# Altium schematic sheet Inputs-and-modules.SchDoc
size A4; SheetNumber: 1; SheetTotal: 4
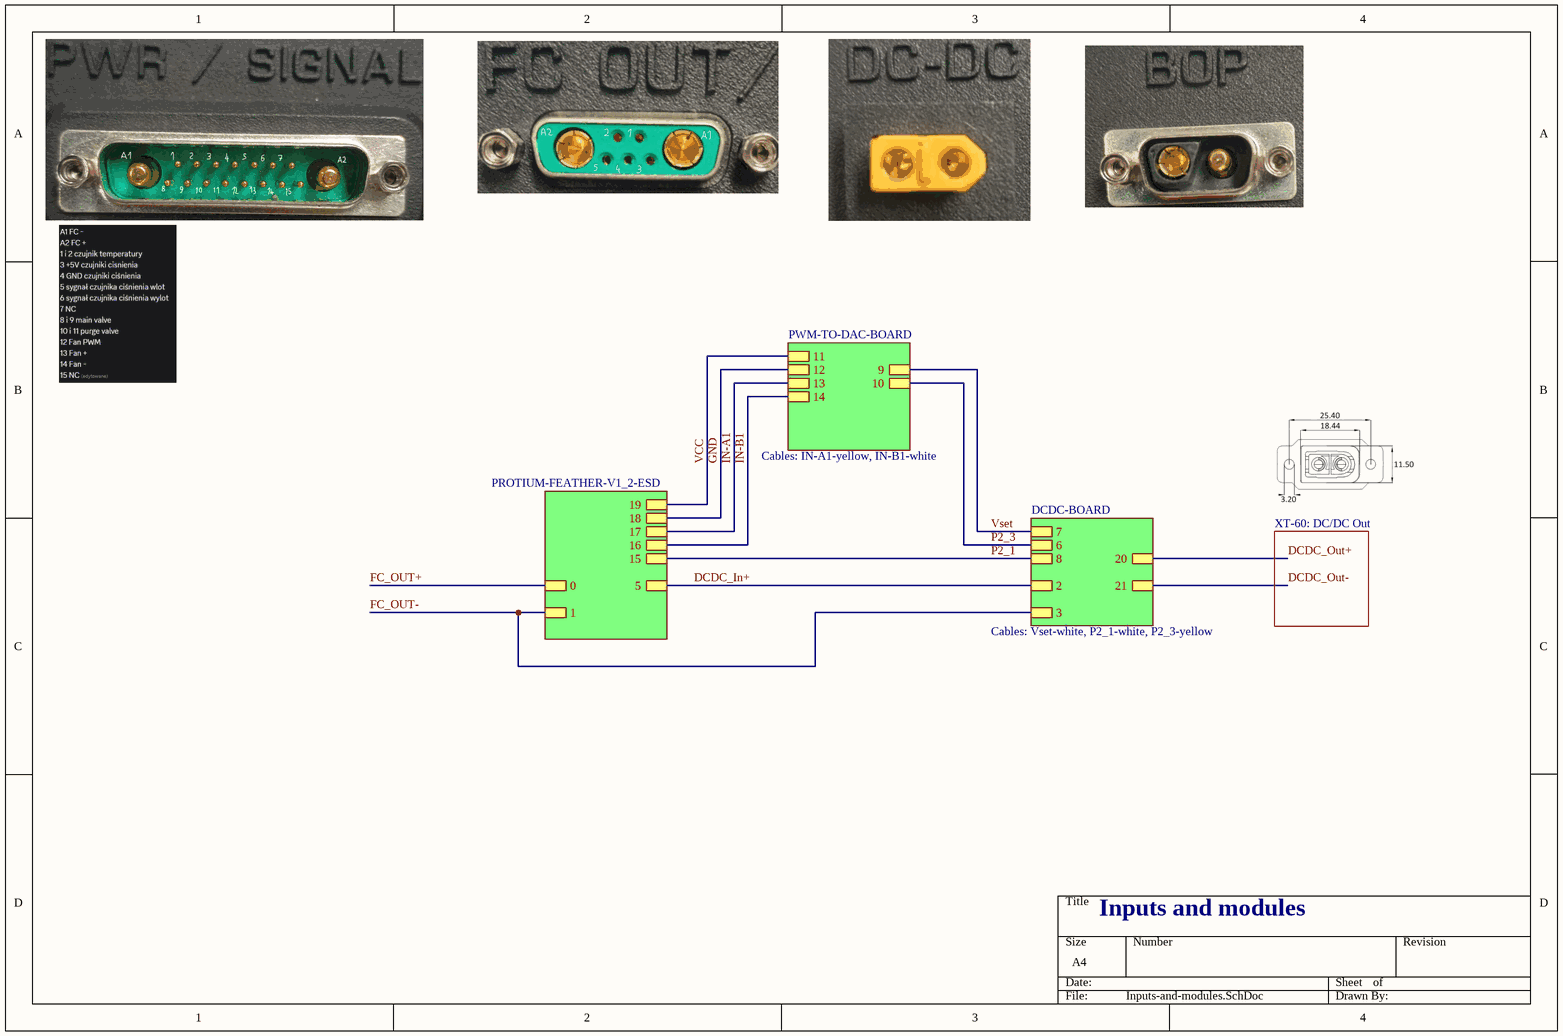
[diagram p0: Inputs-and-modules.SchDoc]

## Sub-sheets
Designator = PWM-TO-DAC-BOARD: 9, 10, 11, 12, 13, 14
Designator = DCDC-BOARD: 2, 3, 6, 7, 8, 20, 21
Designator = PROTIUM-FEATHER-V1_2-ESD: 0, 1, 5, 15, 16, 17, 18, 19

## Nets
DCDC_In+: sheet Designator/2, sheet Designator/5
DCDC_Out+: sheet Designator/20
DCDC_Out-: sheet Designator/21
FC_OUT+: sheet Designator/0
FC_OUT-: sheet Designator/3, sheet Designator/1
GND: sheet Designator/12, sheet Designator/18
IN-A1: sheet Designator/13, sheet Designator/17
IN-B1: sheet Designator/14, sheet Designator/16
P2_1: sheet Designator/8, sheet Designator/15
P2_3: sheet Designator/10, sheet Designator/6
VCC: sheet Designator/11, sheet Designator/19
Vset: sheet Designator/9, sheet Designator/7

## Notes on the sheet
- Cables: IN-A1-yellow, IN-B1-white
- XT-60: DC/DC Out
- Cables: Vset-white, P2_1-white, P2_3-yellow
- Inputs and modules